# Altium schematic sheet Power_Supply.SchDoc: Skipper Power Supply
size 297 x 210 mm; Author: Jack Herron; SheetNumber: 10; SheetTotal: 11
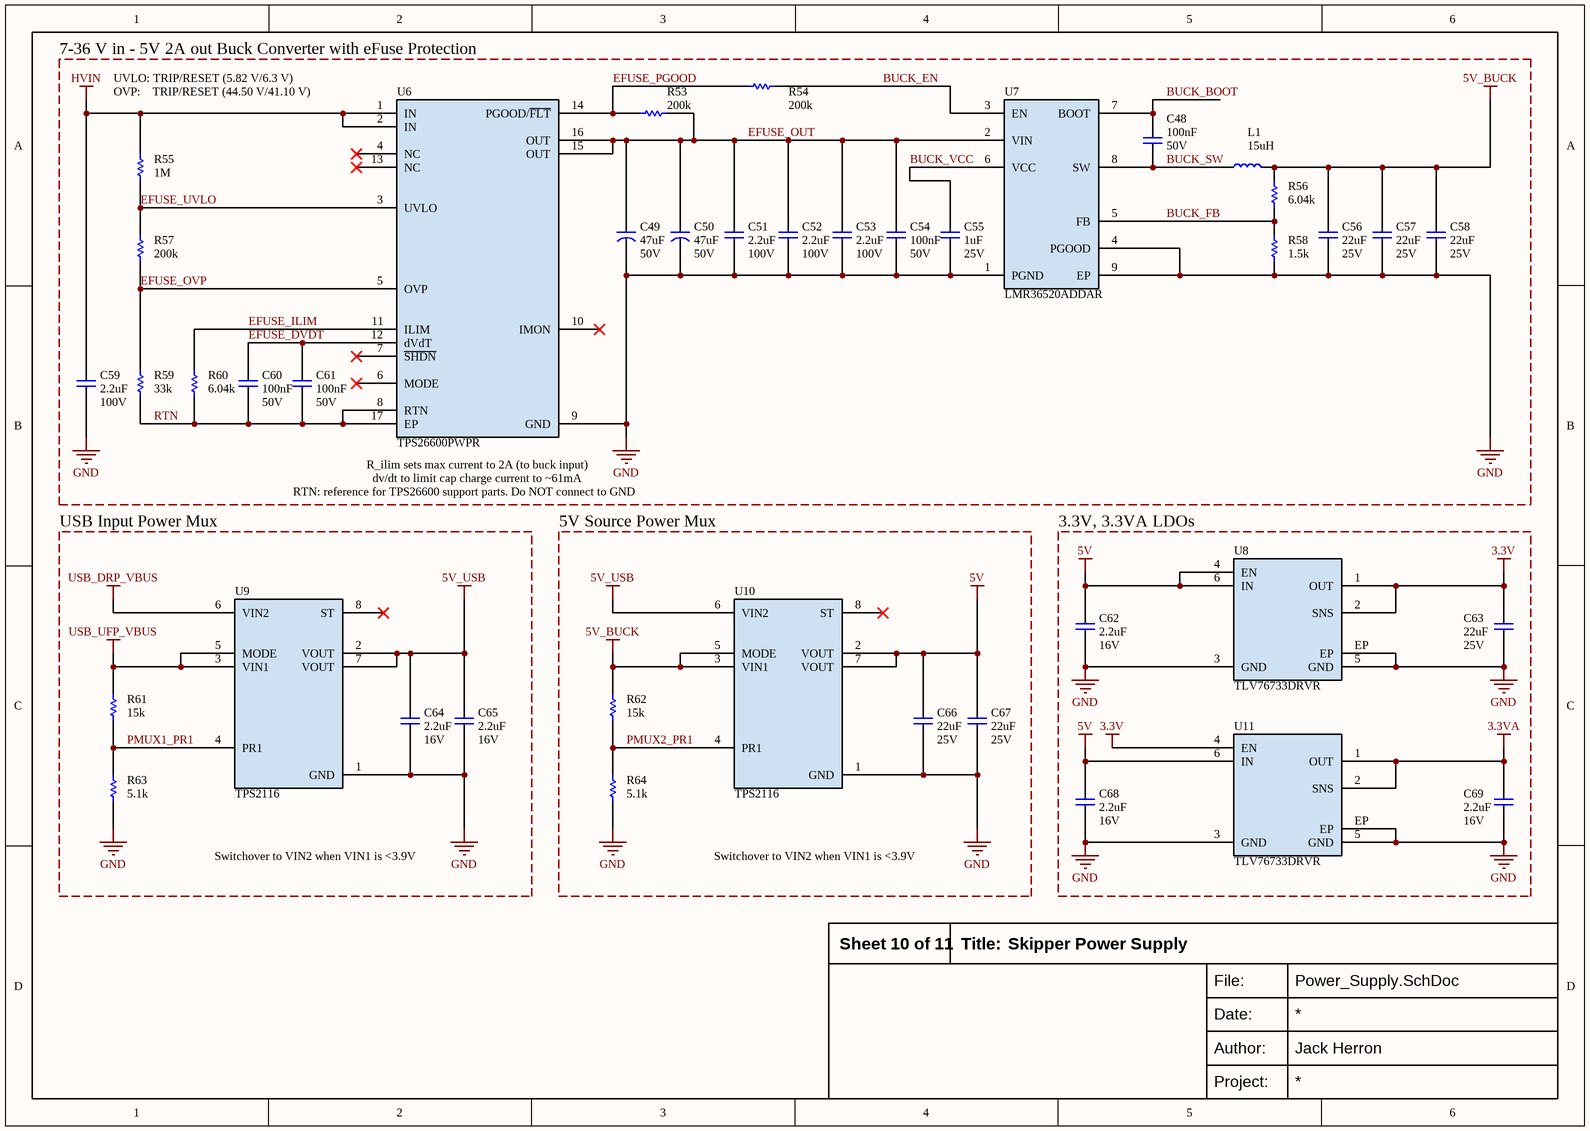
[diagram p0: Power_Supply.SchDoc]

## Parts
C48  value 100nF  Voltage: 50V  [CAPACITOR-0402]  (hidden comment: CL05B104KB54PNC)
C49  value 47uF  Voltage: 50V  [CAPACITOR_6.3x7.7]  (hidden comment: EMLA500ARA470MF80G)
C50  value 47uF  Voltage: 50V  [CAPACITOR_6.3x7.7]  (hidden comment: EMLA500ARA470MF80G)
C51  value 2.2uF  Voltage: 100V  [CAPACITOR-1206]  (hidden comment: CC1206KKX7R0BB225)
C52  value 2.2uF  Voltage: 100V  [CAPACITOR-1206]  (hidden comment: CC1206KKX7R0BB225)
C53  value 2.2uF  Voltage: 100V  [CAPACITOR-1206]  (hidden comment: CC1206KKX7R0BB225)
C54  value 100nF  Voltage: 50V  [CAPACITOR-0402]  (hidden comment: CL05B104KB54PNC)
C55  value 1uF  Voltage: 25V  [CAPACITOR-0402]  (hidden comment: CL05A105KA5NQNC)
C56  value 22uF  Voltage: 25V  [CAPACITOR-1206]  (hidden comment: CL31A226KAHNNNE)
C57  value 22uF  Voltage: 25V  [CAPACITOR-1206]  (hidden comment: CL31A226KAHNNNE)
C58  value 22uF  Voltage: 25V  [CAPACITOR-1206]  (hidden comment: CL31A226KAHNNNE)
C59  value 2.2uF  Voltage: 100V  [CAPACITOR-1206]  (hidden comment: CC1206KKX7R0BB225)
C60  value 100nF  Voltage: 50V  [CAPACITOR-0402]  (hidden comment: CL05B104KB54PNC)
C61  value 100nF  Voltage: 50V  [CAPACITOR-0402]  (hidden comment: CL05B104KB54PNC)
C62  value 2.2uF  Voltage: 16V  [CAPACITOR-0603]  (hidden comment: CL10A225KO8NNNC)
C63  value 22uF  Voltage: 25V  [CAPACITOR-1206]  (hidden comment: CL31A226KAHNNNE)
C64  value 2.2uF  Voltage: 16V  [CAPACITOR-0603]  (hidden comment: CL10A225KO8NNNC)
C65  value 2.2uF  Voltage: 16V  [CAPACITOR-0603]  (hidden comment: CL10A225KO8NNNC)
C66  value 22uF  Voltage: 25V  [CAPACITOR-1206]  (hidden comment: CL31A226KAHNNNE)
C67  value 22uF  Voltage: 25V  [CAPACITOR-1206]  (hidden comment: CL31A226KAHNNNE)
C68  value 2.2uF  Voltage: 16V  [CAPACITOR-0603]  (hidden comment: CL10A225KO8NNNC)
C69  value 2.2uF  Voltage: 16V  [CAPACITOR-0603]  (hidden comment: CL10A225KO8NNNC)
L1  value 15uH  [INDUCTOR_ASPI-0630LR]  (hidden comment: ASPI-0630LR-150M-T15)
R53  value 200k  [RESISTOR-0402]  (hidden comment: 0402WGF2003TCE)
R54  value 200k  [RESISTOR-0402]  (hidden comment: 0402WGF2003TCE)
R55  value 1M  [RESISTOR-0402]  (hidden comment: 0402WGF1004TCE)
R56  value 6.04k  [RESISTOR-0402]  (hidden comment: RC0402FR-076K04L)
R57  value 200k  [RESISTOR-0402]  (hidden comment: 0402WGF2003TCE)
R58  value 1.5k  [RESISTOR-0402]  (hidden comment: 0402WGF1501TCE)
R59  value 33k  [RESISTOR-0402]  (hidden comment: 0402WGF3302TCE)
R60  value 6.04k  [RESISTOR-0402]  (hidden comment: RC0402FR-076K04L)
R61  value 15k  [RESISTOR-0402]  (hidden comment: 0402WGF1502TCE)
R62  value 15k  [RESISTOR-0402]  (hidden comment: 0402WGF1502TCE)
R63  value 5.1k  [RESISTOR-0402]  (hidden comment: 0402WGF5101TCE)
R64  value 5.1k  [RESISTOR-0402]  (hidden comment: 0402WGF5101TCE)
U6  TPS26600PWPR  [TSSOP-16-EP-4.4]
U7  LMR36520ADDAR  [SOIC-8-EP-3.9]
U8  TLV76733DRVR  [WSON-6-2x2]
U9  TPS2116  [SOT-5X3-8]
U10  TPS2116  [SOT-5X3-8]
U11  TLV76733DRVR  [WSON-6-2x2]

## Blocks framed on the sheet
7-36 V in - 5V 2A out Buck Converter with eFuse Protection: C48-C61 L1 R53-R60 U6 U7
USB Input Power Mux: C64 C65 R61 R63 U9
5V Source Power Mux: C66 C67 R62 R64 U10
3.3V, 3.3VA LDOs: C62 C63 C68 C69 U8 U11

## Nets
3.3V: C63.2 U8.1(OUT) U8.2(SNS) U11.4(EN)
3.3VA: C69.2 U11.1(OUT) U11.2(SNS)
5V: C62.2 C66.2 C67.2 C68.2 U8.4(EN) U8.6(IN) U10.2(VOUT) U10.7(VOUT) U11.6(IN)
5V_BUCK: C56.2 C57.2 C58.2 L1.2 R56.2 R62.2 U10.3(VIN1) U10.5(MODE)
5V_USB: C64.2 C65.2 U9.2(VOUT) U9.7(VOUT) U10.6(VIN2)
GND: C49.K C50.K C51.1 C52.1 C53.1 C54.1 C55.1 C56.1 C57.1 C58.1 C59.1 C62.1 C63.1 C64.1 C65.1 C66.1 C67.1 C68.1 C69.1 R58.1 R63.1 R64.1 U6.9(GND) U7.1(PGND) U7.4(PGOOD) U7.9(EP) U8.3(GND) U8.5(GND) U8.EP U9.1(GND) U10.1(GND) U11.3(GND) U11.5(GND) U11.EP
HVIN: C59.2 R55.2 U6.1(IN) U6.2(IN)
USB_DRP_VBUS: U9.6(VIN2)
USB_UFP_VBUS: R61.2 U9.3(VIN1) U9.5(MODE)
BUCK_BOOT: C48.2 U7.7(BOOT)
BUCK_EN: R54.1 U7.3(EN)
BUCK_FB: R56.1 R58.2 U7.5(FB)
BUCK_SW: C48.1 L1.1 U7.8(SW)
BUCK_VCC: C55.2 U7.6(VCC)
EFUSE_DVDT: C60.2 C61.2 U6.12(dVdT)
EFUSE_ILIM: R60.2 U6.11(ILIM)
EFUSE_OUT: C49.A C50.A C51.2 C52.2 C53.2 C54.2 R53.1 U6.15(OUT) U6.16(OUT) U7.2(VIN)
EFUSE_OVP: R57.1 R59.2 U6.5(OVP)
EFUSE_PGOOD: R53.2 R54.2 U6.14(PGOOD/~{FLT})
EFUSE_UVLO: R55.1 R57.2 U6.3(UVLO)
PMUX1_PR1: R61.1 R63.2 U9.4(PR1)
PMUX2_PR1: R62.1 R64.2 U10.4(PR1)
RTN: C60.1 C61.1 R59.1 R60.1 U6.8(RTN) U6.17(EP)

Not connected (* = marked no-connect by the designer): U6 4(NC)* 6(MODE)* 7(~{SHDN})* 10(IMON)* 13(NC)*; U9 8(ST)*; U10 8(ST)*

## Notes on the sheet
- UVLO: TRIP/RESET (5.82 V/6.3 V)
- OVP:    TRIP/RESET (44.50 V/41.10 V)
- (near U6) dv/dt to limit cap charge current to ~61mA
- (near U6) R_ilim sets max current to 2A (to buck input)
- RTN: reference for TPS26600 support parts. Do NOT connect to GND
- Switchover to VIN2 when VIN1 is <3.9V
- Title:
- File:
- Date:
- Project:
- Author:

## Library data of the parts
C48 C54 C60 C61 = CAPACITOR_CL05B104KB54PNC: Capacitor - 100nF - 50V - 0402 - X7R; Manufacturer 1: Samsung; Manufacturer Part Number 1: CL05B104KB54PNC; Supplier 1: LCSC; Supplier Part Number 1: C307331
C49 C50 = CAPACITOR_EMLA500ARA470MF80G: Capacitor - 47uF - 50V; Manufacturer 1: NCC(Nippon Chemi-Con); Supplier 1: LCSC; Supplier Part Number 1: C2972709; Manufacturer Part Number 1: EMLA500ARA470MF80G
C51-C53 C59 = CAPACITOR_CC1206KKX7R0BB225: Capacitor - 2.2uF - 100V - 1206 - X7R; Manufacturer 1: YAGEO; Manufacturer Part Number 1: CC1206KKX7R0BB225; Supplier 1: LCSC; Supplier Part Number 1: C577211
C55 = CAPACITOR_CL05A105KA5NQNC: Capacitor - 1uF - 25V - 0402 - X5R; Manufacturer 1: Samsung; Manufacturer Part Number 1: CL05A105KA5NQNC; Supplier 1: LCSC; Supplier Part Number 1: C52923
C56-C58 C63 C66 C67 = CAPACITOR_CL31A226KAHNNNE: Capacitor - 22uF - 25V - 1206; Manufacturer 1: Samsung; Manufacturer Part Number 1: CL31A226KAHNNNE; Supplier 1: LCSC; Supplier Part Number 1: C12891
C62 C64 C65 C68 C69 = CAPACITOR_CL10A225KO8NNNC: Capacitor - 2.2uF - 16V - 0603 - X5R; Manufacturer 1: Samsung; Manufacturer Part Number 1: CL10A225KO8NNNC; Supplier 1: LCSC; Supplier Part Number 1: C23630
L1 = INDUCTOR_ASPI-0630LR-150M-T15: Power inductor - 15uH - Shielded; Manufacturer 1: Abracon LLC; Manufacturer Part Number 1: ASPI-0630LR-150M-T15; Supplier 1: LCSC; Supplier Part Number 1: C5122440
R53 R54 R57 = RESISTOR_0402WGF2003TCE: Resistor - 200k - 0402; Manufacturer 1: UNI-ROYAL; Wattage: 62.5mW; Voltage: 50V; Manufacturer Part Number 1: 0402WGF2003TCE; Supplier 1: LCSC; Supplier Part Number 1: C25764
R55 = RESISTOR_0402WGF1004TCE: Resistor - 1M - 0402; Manufacturer 1: UNI-ROYAL; Voltage: 50V; Wattage: 62.5mW; Manufacturer Part Number 1: 0402WGF1004TCE; Supplier 1: LCSC; Supplier Part Number 1: C26083
R56 R60 = RESISTOR_RC0402FR-076K04L: Resistor - 6.04k - 0402; Manufacturer 1: Yageo; Voltage: 50V; Wattage: 62.5mW; Manufacturer Part Number 1: RC0402FR-076K04L; Supplier 1: LCSC; Supplier Part Number 1: C97819
R58 = RESISTOR_0402WGF1501TCE: Resistor - 1.5k - 0402; Manufacturer 1: UNI-ROYAL; Voltage: 50V; Wattage: 62.5mW; Manufacturer Part Number 1: 0402WGF1501TCE; Supplier 1: LCSC; Supplier Part Number 1: C25867
R59 = RESISTOR_0402WGF3302TCE: Resistor - 33k - 0402; Manufacturer 1: UNI-ROYAL; Voltage: 50V; Wattage: 62.5mW; Supplier 1: LCSC; Supplier Part Number 1: C25779; Manufacturer Part Number 1: 0402WGF3302TCE
R61 R62 = RESISTOR_0402WGF1502TCE: Resistor - 15k - 0402; Manufacturer 1: UNI-ROYAL; Voltage: 50V; Wattage: 62.5mW; Manufacturer Part Number 1: 0402WGF1502TCE; Supplier 1: LCSC; Supplier Part Number 1: C25756
R63 R64 = RESISTOR_0402WGF5101TCE: Resistor - 5.1k - 0402; Manufacturer 1: UNI-ROYAL; Voltage: 50V; Wattage: 62.5mW; Manufacturer Part Number 1: 0402WGF5101TCE; Supplier 1: LCSC; Supplier Part Number 1: C25905
U6 = EFUSE_TPS2660x: 150mΩ efuse - reverse blocking; Manufacturer 1: Texas Instruments; Manufacturer Part Number 1: TPS26600PWPR; Supplier 1: LCSC; Supplier Part Number 1: C544399
U7 = REGULATOR_BUCK_LMR36520: 2A syncronous buck converter; Manufacturer 1: Texas Instruments; Manufacturer Part Number 1: LMR36520ADDAR; Supplier 1: LCSC; Supplier Part Number 1: C2879422
U8 U11 = REGULATOR_Linear_3.3V_TLV76733DRVR: LDO - 16V input - 3.3V output - 1A; Manufacturer 1: Texas Instruments; Manufacturer Part Number 1: TLV76733DRVR; Supplier 1: LCSC; Supplier Part Number 1: C2848334
U9 U10 = POWER-MUX_2-Channel_TPS2116: Priority power mux - 2 Channel; Manufacturer 1: Texas Instruments; Manufacturer Part Number 1: TPS2116DRLR; Supplier 1: LCSC; Supplier Part Number 1: C3235557